# Altium schematic sheet 04_Monitor_MCU.SchDoc
size A3; SheetNumber: 5; SheetTotal: 6
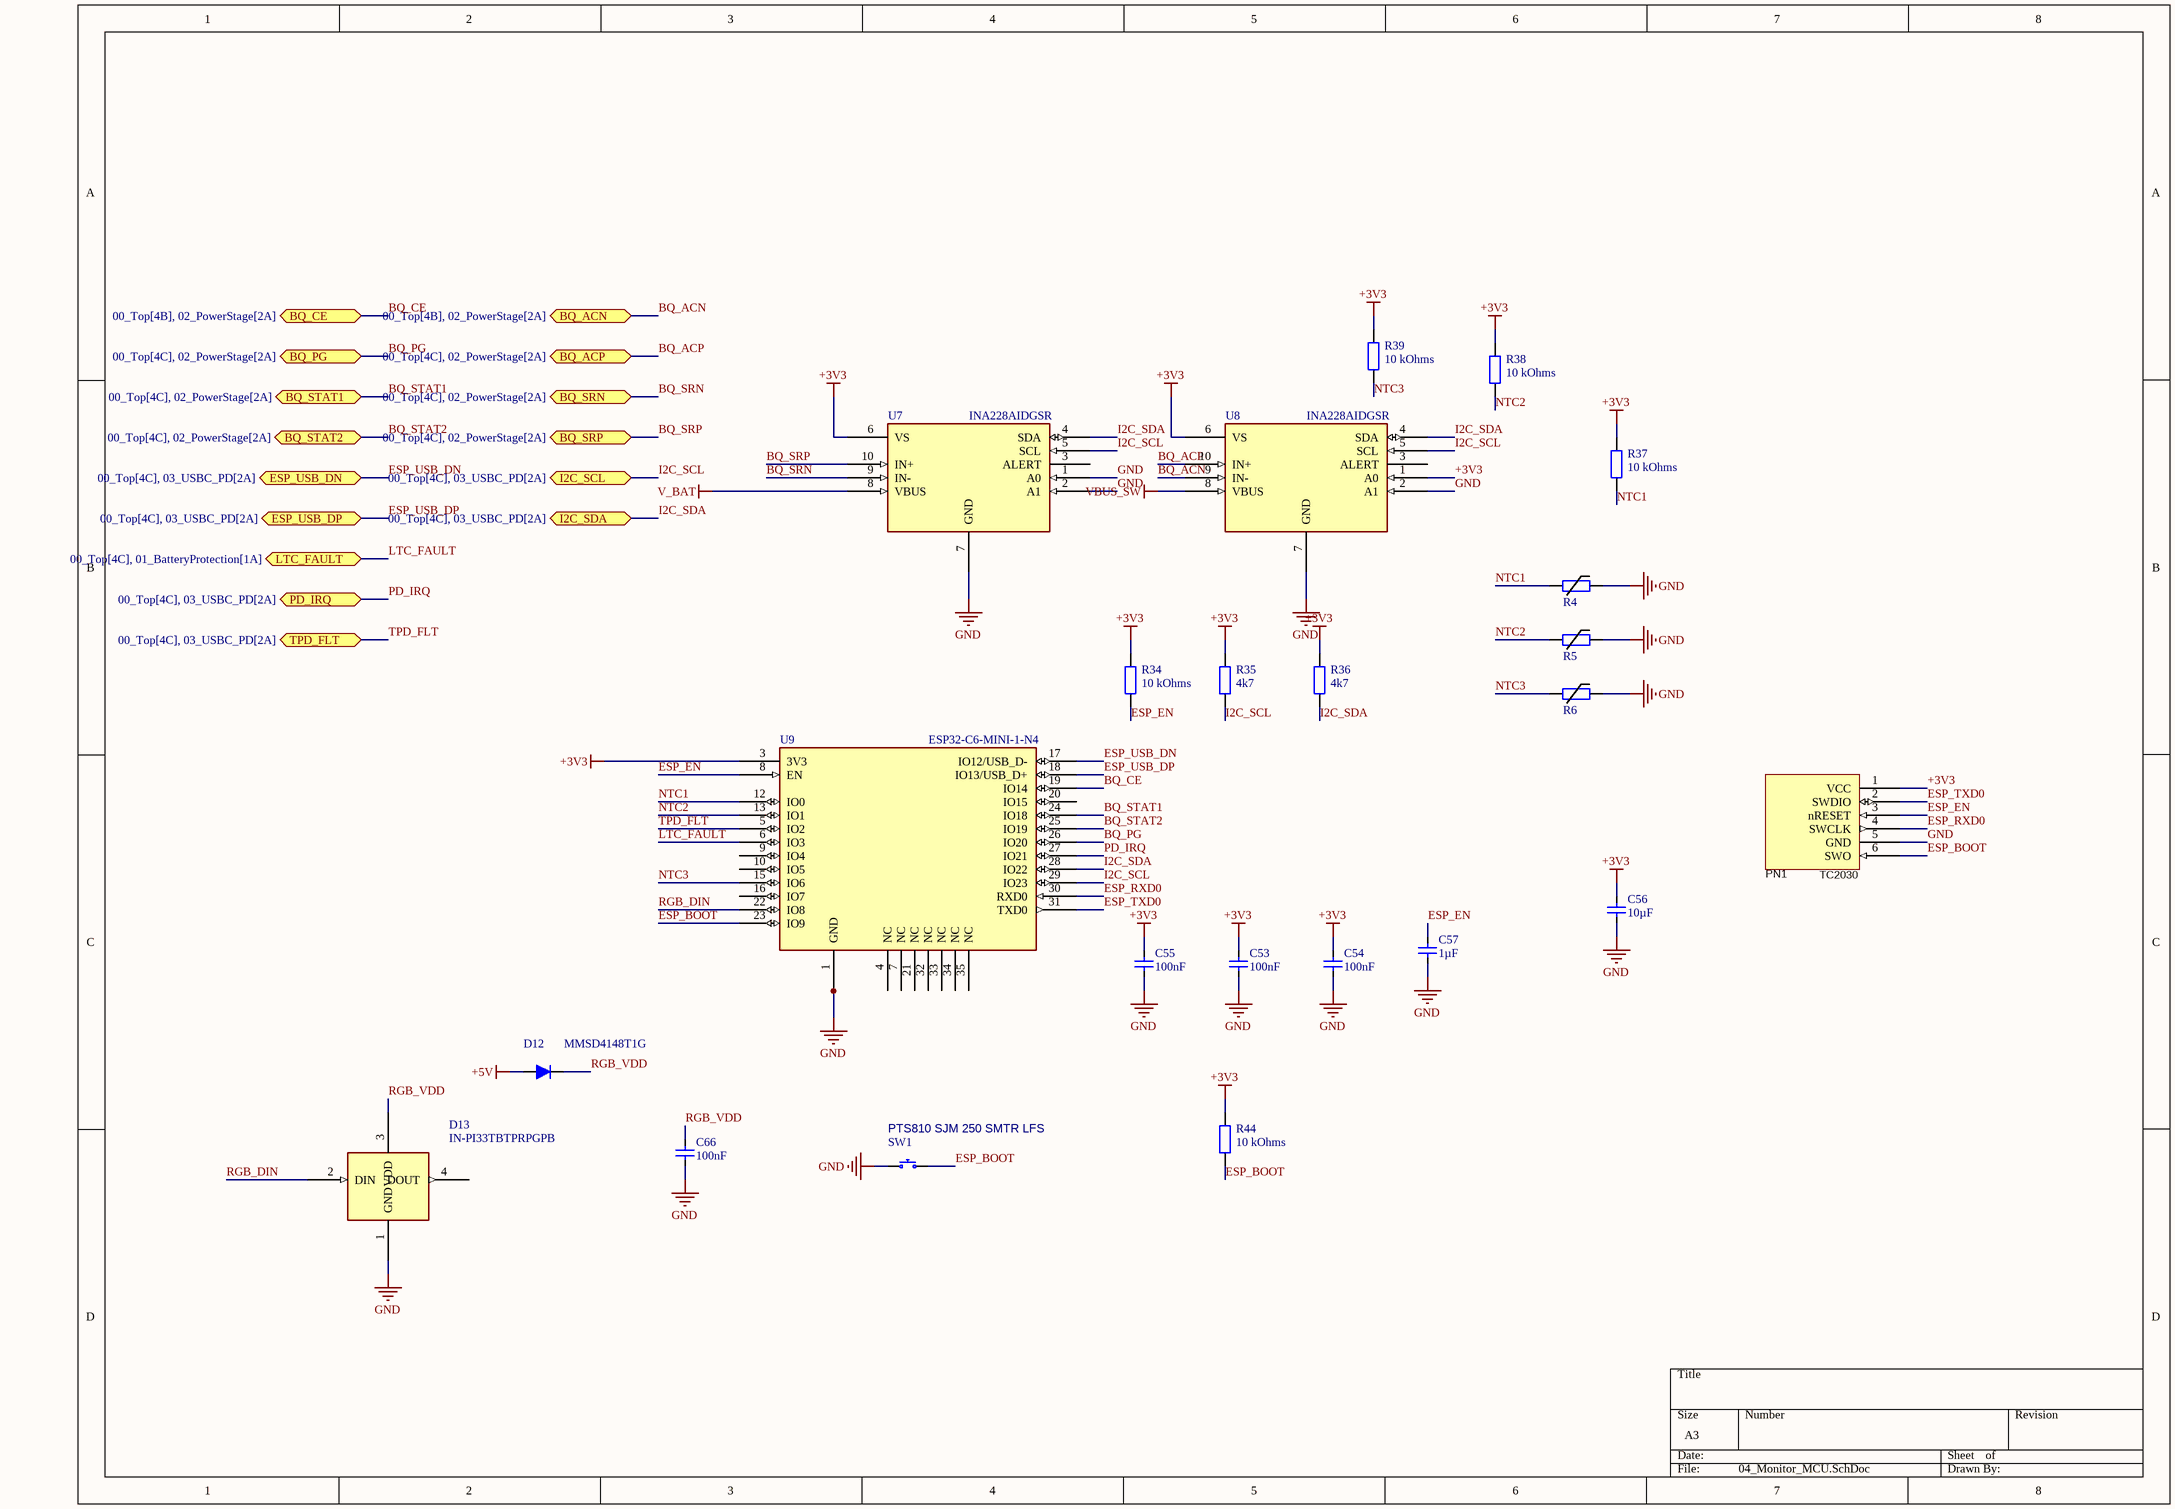
[diagram p0: 04_Monitor_MCU.SchDoc]

## Parts
C53  100nF  [CAPC1005X06N]
C54  100nF  [CAPC1005X06N]
C55  100nF  [CAPC1005X06N]
C56  10µF  [CAPC2012X15N]
C57  1µF  [CAPC1608X10N]
C66  100nF  [CAPC1005X06N]
D12  MMSD4148T1G  [SOD3716X135N]
D13  IN-PI33TBTPRPGPB  [LED_RGB_3535_ADDR]
PN1  TC2030  [TC2030-MCP-NL-SINGLE]  (no BOM)
R4  NTC 10K  [RESC1608X06N]  (value not drawn)
R5  NTC 10K  [RESC1608X06N]  (value not drawn)
R6  NTC 10K  [RESC1608X06N]  (value not drawn)
R34  10 kOhms  [RESC1005X04N]
R35  4k7  [RESC1005X04N]
R36  4k7  [RESC1005X04N]
R37  10 kOhms  [RESC1005X04N]
R38  10 kOhms  [RESC1005X04N]
R39  10 kOhms  [RESC1005X04N]
R44  10 kOhms  [RESC1005X04N]
SW1  PTS810 SJM 250 SMTR LFS  [C&K_PTS810]
U7  INA228AIDGSR  [MSOP10]
U8  INA228AIDGSR  [MSOP10]
U9  ESP32-C6-MINI-1-N4  [ESP32-C6-MINI-1-N4]

## Ports
BQ_ACN (bidir, see 00_Top[4B], 02_PowerStage[2A]), BQ_ACP (bidir, see 00_Top[4C], 02_PowerStage[2A]), BQ_CE (bidir, see 00_Top[4B], 02_PowerStage[2A]), BQ_PG (bidir, see 00_Top[4C], 02_PowerStage[2A]), BQ_SRN (bidir, see 00_Top[4C], 02_PowerStage[2A]), BQ_SRP (bidir, see 00_Top[4C], 02_PowerStage[2A]), BQ_STAT1 (bidir, see 00_Top[4C], 02_PowerStage[2A]), BQ_STAT2 (bidir, see 00_Top[4C], 02_PowerStage[2A]), ESP_USB_DN (bidir, see 00_Top[4C], 03_USBC_PD[2A]), ESP_USB_DP (bidir, see 00_Top[4C], 03_USBC_PD[2A]), I2C_SCL (bidir, see 00_Top[4C], 03_USBC_PD[2A]), I2C_SDA (bidir, see 00_Top[4C], 03_USBC_PD[2A]), LTC_FAULT (bidir, see 00_Top[4C], 01_BatteryProtection[1A]), PD_IRQ (bidir, see 00_Top[4C], 03_USBC_PD[2A]), TPD_FLT (bidir, see 00_Top[4C], 03_USBC_PD[2A])

## Nets
+3V3: C53.2 C54.2 C55.2 C56.2 PN1.1(VCC) R34.2 R35.2 R36.2 R37.2 R38.2 R39.2 R44.2 U7.6(VS) U8.1(A0) U8.6(VS) U9.3(3V3)
+5V: D12.A
GND: C53.1 C54.1 C55.1 C56.1 C57.1 C66.1 D13.1(GND) PN1.5(GND) R4.2 R5.2 R6.2 SW1.2(COM) U7.1(A0) U7.2(A1) U7.7(GND) U8.2(A1) U8.7(GND) U9.1(GND) U9.2(GND) U9.11(GND) U9.14(GND) U9.36(GND) U9.37(GND) U9.38(GND) U9.39(GND) U9.40(GND) U9.41(GND) U9.42(GND) U9.43(GND) U9.44(GND) U9.45(GND) U9.46(GND) U9.47(GND) U9.48(GND) U9.49(GND) U9.50(GND) U9.51(GND) U9.52(GND) U9.53(GND)
V_BAT: U7.8(VBUS)
VBUS_SW: U8.8(VBUS)
BQ_ACN: U8.9(IN-) ; port BQ_ACN
BQ_ACP: U8.10(IN+) ; port BQ_ACP
BQ_CE: U9.19(IO14) ; port BQ_CE
BQ_PG: U9.26(IO20) ; port BQ_PG
BQ_SRN: U7.9(IN-) ; port BQ_SRN
BQ_SRP: U7.10(IN+) ; port BQ_SRP
BQ_STAT1: U9.24(IO18) ; port BQ_STAT1
BQ_STAT2: U9.25(IO19) ; port BQ_STAT2
ESP_BOOT: PN1.6(SWO) R44.1 SW1.1(N.O) U9.23(IO9)
ESP_EN: C57.2 PN1.3(nRESET) R34.1 U9.8(EN)
ESP_RXD0: PN1.4(SWCLK) U9.30(RXD0)
ESP_TXD0: PN1.2(SWDIO) U9.31(TXD0)
ESP_USB_DN: U9.17(IO12/USB_D-) ; port ESP_USB_DN
ESP_USB_DP: U9.18(IO13/USB_D+) ; port ESP_USB_DP
I2C_SCL: R35.1 U7.5(SCL) U8.5(SCL) U9.29(IO23) ; port I2C_SCL
I2C_SDA: R36.1 U7.4(SDA) U8.4(SDA) U9.28(IO22) ; port I2C_SDA
LTC_FAULT: U9.6(IO3) ; port LTC_FAULT
NTC1: R4.1 R37.1 U9.12(IO0)
NTC2: R5.1 R38.1 U9.13(IO1)
NTC3: R6.1 R39.1 U9.15(IO6)
PD_IRQ: U9.27(IO21) ; port PD_IRQ
RGB_DIN: D13.2(DIN) U9.22(IO8)
RGB_VDD: C66.2 D12.K D13.3(VDD)
TPD_FLT: U9.5(IO2) ; port TPD_FLT

Not connected (* = marked no-connect by the designer): D13 4(DOUT); U7 3(ALERT); U8 3(ALERT); U9 4(NC) 7(NC) 9(IO4) 10(IO5) 16(IO7) 20(IO15) 21(NC) 32(NC) 33(NC) 34(NC) 35(NC)

## Library data of the parts
C53-C55 C66 = CGA2B1X7R1C104K050BC: CAP CER 0.1UF 16V X7R 0402; Manufacturer 1: TDK Corporation; AEC-Q200: True; Capacitance: 0.1 µF; Tolerance: ±10%; Case Code (Imperial): 0402; Manufacturer Part Number 1: CGA2B1X7R1C104K050BC; Mounting Type: Surface Mount, MLCC; Part Name: CGA2B1X7R1C104K050BC; Supplier 1: Digi-Key; Supplier Part Number 1: 445-5613-1-ND; Temperature Coefficient: X7R; Voltage Rating: 16V
C56 = CGA4J1X7S1C106K125AC: CAP CER 10UF 16V X7S 0805; Manufacturer 1: TDK Corporation; AEC-Q200: True; Tolerance: ±10%; Capacitance: 10 µF; Case Code (Imperial): 0805; Manufacturer Part Number 1: CGA4J1X7S1C106K125AC; Mounting Type: Surface Mount, MLCC; Part Name: CGA4J1X7S1C106K125AC; Supplier 1: Digi-Key; Supplier Part Number 1: 445-16110-1-ND; Temperature Coefficient: X7S; Voltage Rating: 16V
C57 = CGA3E1X7R1C105M080AC: CAP CER 1UF 16V X7R 0603; Manufacturer 1: TDK Corporation; AEC-Q200: True; Tolerance: ±20%; Capacitance: 1 µF; Case Code (Imperial): 0603; Manufacturer Part Number 1: CGA3E1X7R1C105M080AC; Mounting Type: 0.063" L x 0.031" W (1.60mm x 0.80mm); Part Name: CGA3E1X7R1C105M080AC; Supplier 1: Digi-Key; Supplier Part Number 1: 445-12540-1-ND; Temperature Coefficient: X7R; Voltage Rating: 16V
D12 = MMSD4148T1G: DIODE GEN PURP 100V 200MA SOD123; Manufacturer 1: onsemi; AEC-Q200: False; Diode Type: Standard; Voltage Forward: 1 V @ 10 mA; Current Average: 200mA; Manufacturer Part Number 1: MMSD4148T1G; Package / Case: SOD-123; Part Name: MMSD4148T1G; Supplier 1: Digi-Key; Supplier Device Package: SOD-123; Supplier Part Number 1: MMSD4148T1GOSCT-ND; Voltage Reverse: 100 V
D13 = IN-PI33TBTPRPGPB: ADDRESS LED DISCRETE SERIAL RGB; Manufacturer 1: Inolux; AEC-Q200: False; Current Average: 12mA Red, 12mA Green, 12mA Blue; Diode Type: LED (addressable); Voltage Forward: VDD 3.5-5.5 V; Manufacturer Part Number 1: IN-PI33TBTPRPGPB; Package / Case: 4-PLCC, 3535; Part Name: IN-PI33TBTPRPGPB; Supplier 1: Digi-Key; Supplier Device Package: -; Supplier Part Number 1: 1830-1208-1-ND; Voltage Reverse: -
PN1 = TC2030-MCP-NL-SINGLE: TAG CONNECT 2030 6 PIN; Part Name: TC2030-MCP-NL-SINGLE; Supplier 1: None; Supplier Part Number 1: TC2030; Manufacturer 1: Tag Connect; Manufacturer Part Number 1: TC2030
R4-R6 = NTCS0603E3103FMT: THERMISTOR NTC 10KOHM 3610K 0603; Manufacturer 1: Vishay Beyschlag/Draloric/BC Components; Resistance: 10 kOhms; Power (Watts): 0.125W, 1/8W; Tolerance: ±1%; AEC-Q200: True; Part Name: NTCS0603E3103FMT; Supplier 1: Digi-Key; Supplier Part Number 1: BC2472TR-ND; Manufacturer Part Number 1: NTCS0603E3103FMT; Case Code (Imperial): 0603
R34 = ERJ-2RKF1002X: RES SMD 10K OHM 1% 1/10W 0402; Manufacturer 1: Panasonic Industry; Power (Watts): 0.1W, 1/10W; AEC-Q200: False; Part Name: ERJ-2RKF1002X; Supplier 1: Digi-Key; Supplier Part Number 1: P10.0KLTR-ND; Manufacturer Part Number 1: ERJ-2RKF1002X; Case Code (Imperial): 0402; Resistance: 10 kOhms; Tolerance: ±1%
R35 R36 = ERJ-2RKF4701X: RES SMD 4.7K OHM 1% 1/10W 0402; Manufacturer 1: Panasonic Electronic Components; Resistance: 4.7 kOhms; Power (Watts): 0.1W, 1/10W; AEC-Q200: True; Part Name: ERJ-2RKF4701X; Supplier 1: Digi-Key; Supplier Part Number 1: P4.70KLCT-ND; Manufacturer Part Number 1: ERJ-2RKF4701X; Case Code (Imperial): 0402; Tolerance: ±1%
R37-R39 R44 = ERJ-2RKF1002X: RES SMD 10K OHM 1% 1/10W 0402; Manufacturer 1: Panasonic Industry; AEC-Q200: False; Power (Watts): 0.1W, 1/10W; Case Code (Imperial): 0402; Manufacturer Part Number 1: ERJ-2RKF1002X; Part Name: ERJ-2RKF1002X; Resistance: 10 kOhms; Supplier 1: Digi-Key; Supplier Part Number 1: P10.0KLTR-ND; Tolerance: ±1%
SW1 = PTS810 SJM 250 SMTR LFS: SWITCH TACTILE SPST-NO 0.05A 16V; Manufacturer 1: C&K; Manufacturer Part Number 1: PTS810 SJM 250 SMTR LFS; Part Name: PTS810 SJM 250 SMTR LFS; Supplier 1: Digi-Key; Supplier Part Number 1: CKN10502CT-ND
U7 U8 = INA228AIDGSR: IC PWR MONITOR 10VSSOP; Manufacturer 1: Texas Instruments; Function: Digital Power Monitor; AEC-Q200: False; Part Name: INA228AIDGSR; Supplier 1: Digi-Key; Supplier Part Number 1: 296-INA228AIDGSRTR-ND; Manufacturer Part Number 1: INA228AIDGSR; Package / Case: 10-TFSOP, 10-MSOP (0.118", 3.00mm Width); Supplier Device Package: 10-VSSOP
U9 = ESP32-C6-MINI-1-N4: RF TXRX MOD BT WIFI PCB TH SMD; Manufacturer 1: Espressif Systems; AEC-Q200: False; Part Name: ESP32-C6-MINI-1-N4; Supplier 1: Digi-Key; Supplier Part Number 1: 1965-ESP32-C6-MINI-1-N4TR-ND; Manufacturer Part Number 1: ESP32-C6-MINI-1-N4; Function: -; Package / Case: 53-SMD Module; Supplier Device Package: -